# Altium schematic sheet Encoder.SchDoc
size A; SheetNumber: 4; SheetTotal: 4
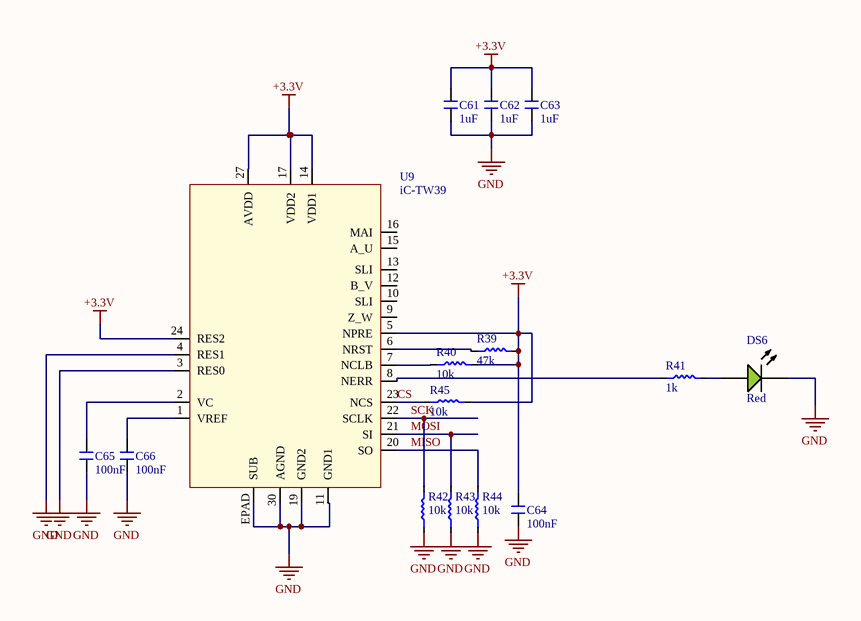
[diagram p0: Encoder.SchDoc]

## Parts
C61  1uF  [C_0402]
C62  1uF  [C_0402]
C63  1uF  [C_0402]
C64  100nF  [C_0402]
C65  100nF  [C_0402]
C66  100nF  [C_0402]
DS6  Red  [EVRL-0603-2_V]
R39  47k  [R_0402]
R40  10k  [R_0402]
R41  1k  [R_0402]
R42  10k  [R_0402]
R43  10k  [R_0402]
R44  10k  [R_0402]
R45  10k  [R_0402]
U9  iC-TW39  [iC-TW39]

## Nets
+3.3V: C61.2 C62.2 C63.2 C64.2 R39.1 R40.1 R45.1 U9.5(NPRE) U9.14(VDD1) U9.17(VDD2) U9.24(RES2) U9.27(AVDD)
GND: C61.1 C62.1 C63.1 C64.1 C65.1 C66.1 DS6.2(K) R42.2 R43.2 R44.2 U9.3(RES0) U9.4(RES1) U9.11(GND1) U9.19(GND2) U9.30(AGND) U9.EPAD(SUB)
CS: R45.2 U9.23(NCS)
MISO: R44.1 U9.20(SO)
MOSI: R43.1 U9.21(SI)
SCK: R42.1 U9.22(SCLK)
NetC65_2: C65.2 U9.2(VC)
NetC66_2: C66.2 U9.1(VREF)
NetDS6_1: DS6.1(A) R41.1
NetR39_2: R39.2 U9.6(NRST)
NetR40_2: R40.2 U9.7(NCLB)
NetR41_2: R41.2 U9.8(NERR)

Not connected (* = marked no-connect by the designer): U9 9(Z_W) 10(SLI) 12(B_V) 13(SLI) 15(A_U) 16(MAI)

## Library data of the parts
C61-C66 = C_0402
DS6 = CMP-007-00002-2: Chip LED, Yellow-Green, 5 V, 25 mA, -40 to 85 degC, 2-Pin SMD (0603), RoHS, Tape and Reel; Manufacturer: Everlight Electronics; Forward Voltage: 2V; Lens Style: Clear; Viewing Angle: 120degrees; Colour: Green; Mounting Technology: SM; Datasheet Version: Rev. 1, 04/2006; Package Description: 2-Pin Surface Mount Device, Body 1.6 x 0.8 mm; RoHS Compliant: True; Package Reference: 0603; Pins: 2; Manufacturer URL: http://www.everlight.com/; Datasheet URL: https://datasheet.ciiva.com/48679/19-217-g7c-an1p2-3t-48679179.pdf; Case/Package: 0603
R39-R45 = R_0402